# Altium schematic sheet COM.schdoc
size 297 x 210 mm; Symbol: Sheet-Symbol_A4; Company: 嘉立创EDA; Version: V1.0; Page Size: A4; @Project Name: 【全网首发】X86电脑主板_copy; @Page Count: 19; @Update Date: 2025-10-09; @Create Date: 2025-10-09; @Schematic Name: SCHEMATIC1_1; @Page No: 0; @Page Name: COM; Device: Sheet-Symbol_A4_1
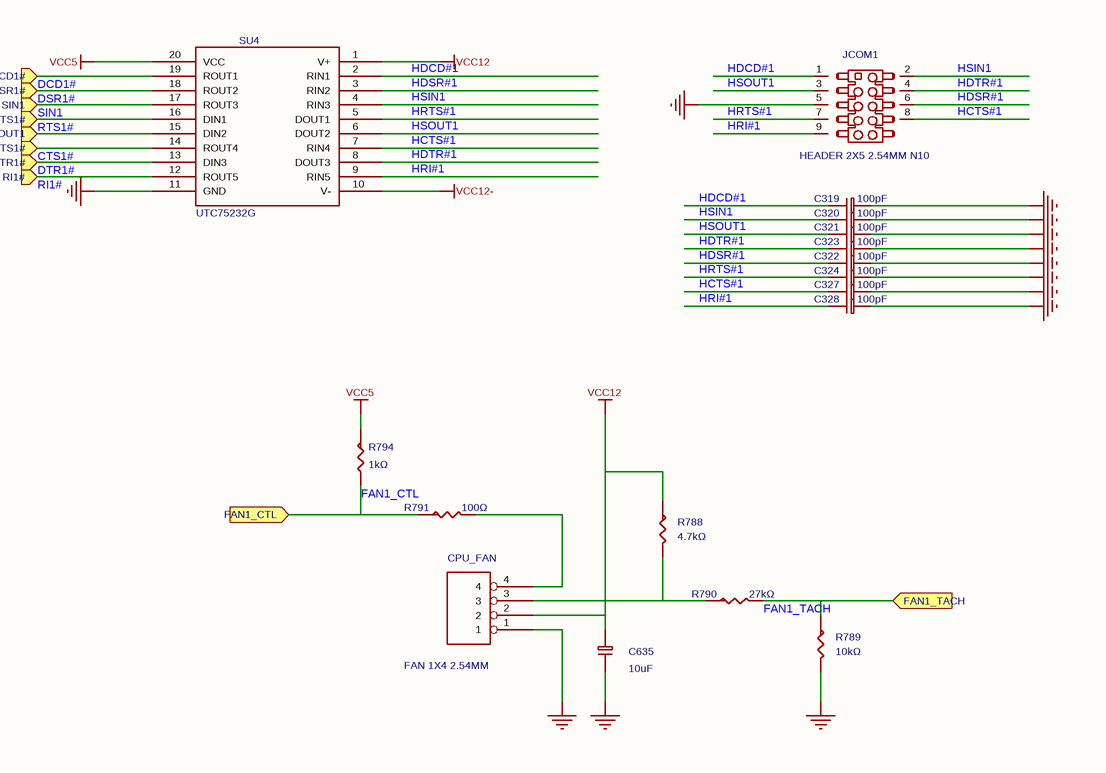
[diagram p0: COM.schdoc]

## Parts
C319  100pF  [C0402_2]
C320  100pF  [C0402]
C321  100pF  [C0402]
C322  100pF  [C0402_2]
C323  100pF  [C0402]
C324  100pF  [C0402]
C327  100pF  [C0402]
C328  100pF  [C0402]
C635  10uF  [C0805]
CPU_FAN  value FAN 1X4 2.54MM  [FAN4P]  (hidden comment: HF1004E)
JCOM1  value HEADER 2X5 2.54MM N10  [PIN2X5_2D54_NC10]  (hidden comment: 210-92-05GB02)
R788  4.7kΩ  [R0402_1]
R789  10kΩ  [R0402_3]
R790  27kΩ  [R0402_1]
R791  100Ω  [R0402_1]
R794  1kΩ  [R0402_3]
SU4  value UTC75232G  [TSSOP20]  (hidden comment: DS14185_0)

## Ports
CTS1# (in), DCD1# (in), DSR1# (in), DTR1# (in), FAN1_CTL (in), FAN1_TACH (in), RI1# (in), RTS1# (in), SIN1 (in), SOUT1 (in)

## Nets
GND: C319.2 C320.2 C321.2 C322.2 C323.2 C324.2 C327.2 C328.2 C635.1 CPU_FAN.1 JCOM1.5 R789.2 SU4.11(GND)
VCC5: R794.1 SU4.20(VCC)
VCC12: C635.2 CPU_FAN.2 R788.1 SU4.1(V+)
VCC12-: SU4.10(V-)
CTS1#: SU4.14(ROUT4) ; port CTS1#
DCD1#: SU4.19(ROUT1) ; port DCD1#
DSR1#: SU4.18(ROUT2) ; port DSR1#
DTR1#: SU4.13(DIN3) ; port DTR1#
FAN1_CTL: R791.1 R794.2 ; port FAN1_CTL
FAN1_TACH: R789.1 R790.2 ; port FAN1_TACH
HCTS#1: C327.1 JCOM1.8 SU4.7(RIN4)
HDCD#1: C319.1 JCOM1.1 SU4.2(RIN1)
HDSR#1: C322.1 JCOM1.6 SU4.3(RIN2)
HDTR#1: C323.1 JCOM1.4 SU4.8(DOUT3)
HRI#1: C328.1 JCOM1.9 SU4.9(RIN5)
HRTS#1: C324.1 JCOM1.7 SU4.5(DOUT1)
HSIN1: C320.1 JCOM1.2 SU4.4(RIN3)
HSOUT1: C321.1 JCOM1.3 SU4.6(DOUT2)
RI1#: SU4.12(ROUT5) ; port RI1#
RTS1#: SU4.16(DIN1) ; port RTS1#
SIN1: SU4.17(ROUT3) ; port SIN1
SOUT1: SU4.15(DIN2) ; port SOUT1
NetCPU_FAN_3: CPU_FAN.3 R788.2 R790.1
NetCPU_FAN_4: CPU_FAN.4 R791.2

## Notes on the sheet
- 更新日期
- 2025-10-09
- 原理图
- 图页
- SCHEMATIC1_1
- COM
- 创建日期
- 物料编码
- 审阅
- 绘制
- 【全网首发】X86电脑主板_copy
- 版本
- V1.0
- 尺寸
- A4
- 页
- 0
- 嘉立创EDA
- 共
- 19

## Library data of the parts
C319-C324 C327 C328 = 0402CG101J500NT: 容值:100pF;精度:±5%;额定电压:50V;材质(温度系数):C0G;; Manufacturer: FH(风华); Symbol: C-0603_4; ModelId: 36a51122f27c49738f86b3bfa98863e0; Tolerance: ±5%; AddInBom: yes; Voltage Rated: 50V; ModelName: C0402_L1.0-W0.5-H0.5; ModelTransform: 39.37,19.685,0,0,0,0,0,0,0; Temperature Coefficient: C0G; Device: 0402CG101J500NT; Value: 100pF; Supplier: LCSC; SupplierPart: C1546; ConvertToPcb: yes; LCSC Part Name: 100pF ±5% 50V; JLCPCB Part Class: Basic Part; ManufacturerPart: 0402CG101J500NT; Supplier Footprint: 0402
  C319 C322: FootprintName: C0402_2
  C320 C321 C323 C324 C327 C328: FootprintName: C0402
C635 = CL21A106KOQNNNE: 容值:10uF;精度:±10%;额定电压:16V;材质(温度系数):X5R;; Manufacturer: SAMSUNG(三星); Symbol: CAP NP_31; ModelId: 1ba041120af144c991958decab20d241; Tolerance: ±10%; AddInBom: yes; Voltage Rated: 16V; ModelName: C0805_L2.0-W1.3-H1.3; ModelTransform: 78.74,51.181,0,0,0,0,0,0.0005,0; Temperature Coefficient: X5R; Device: CL21A106KOQNNNE; Value: 10uF; Supplier: LCSC; Datasheet: https://atta.szlcsc.com/upload/public/pdf/source/20160103/1457707694240.pdf; FootprintName: C0805; SupplierPart: C1713; ConvertToPcb: yes; LCSC Part Name: 10uF ±10% 16V; JLCPCB Part Class: Extended Part; ManufacturerPart: CL21A106KOQNNNE; Supplier Footprint: 0805
CPU_FAN = HF1004E: 插针结构:1x4P;间距:2.54mm;安装方式:直插;参考系列:-;总PIN数:4P;排数:1;每排PIN数:4;行距:-;额定电流:-;工作温度范围:-;; Manufacturer: FOXCONN(富士康); Symbol: HEADER 4_0; AddInBom: yes; ModelId: ec34a5bd49134116a835459c2f382328; ModelName: CONN-TH_4P-P2.54_HF1004E; ModelTransform: 400.039,225.1964,0,0,0,0,0,12.008,-137.795; Pins Structure: 1x4P; Pitch: 2.54mm; Number of PINs Per Row: 4; Device: HF1004E; JLCPCB Part Class: Extended Part; LCSC Part Name: 1x4P 间距:2.54mm 直插; SupplierPart: C2761402; ManufacturerPart: HF1004E; Supplier Footprint: 插件,P=2.54mm; Datasheet: https://atta.szlcsc.com/upload/public/pdf/source/20210329/C2761402_8B7F6B32F26E3706188E3A95E69D0044.pdf; Supplier: LCSC; ConvertToPcb: yes; FootprintName: FAN4P; Mounting Style: 直插; Reference Series: -; Number of Pins: 4P; Number of Rows: 1; Row Spacing: -; Current Rating (Max): -; Operating Temperature Range: -
JCOM1 = 210-92-05GB02: 插针结构:2x5P;间距:2.54mm;行距:2.54mm;圆针/方针:方针;安装类型:直插;排数:双排;总PIN位数:10P;额定电流:3A;额定电压:-;配合针长度:6.1mm;塑高:2.5mm;端接针长度:3mm;触头材质:黄铜;触头镀层:-;工作温度范围:-40℃~+105℃;颜色:黑色;; Manufacturer: PINREX(频锐科技); Symbol: PIN HEADER 2X7 2_0.54; AddInBom: yes; ModelId: 4a96607ad93f48408c2a0a6543c48f7d; ModelName: HDR-TH_9P-P2.54-M-LI-2X5P; ModelTransform: 490.157,196.85,0,0,0,0,0,0,-118.11; Pin Structure: 2x5P; Pitch: 2.54mm; Circluar Pins/Square Pins: 方针; Current Rating (Max): 3A; Device: 210-92-05GB02; JLCPCB Part Class: Extended Part; LCSC Part Name: 间距:2.54mm 2x5P 直插 方针 黑金; SupplierPart: C390689; ManufacturerPart: 210-92-05GB02; Supplier Footprint: 插件,P=2.54mm; Datasheet: https://atta.szlcsc.com/upload/public/pdf/source/20190506/C390689_DC56D71BCD7C484749B58F96D2D2D6C5.pdf; Supplier: LCSC; ConvertToPcb: yes; FootprintName: PIN2X5_2D54_NC10; Row Spacing: 2.54mm; Mounting Type: 直插; Number of Rows: 双排; Number of Pins: 10P; Voltage Rating (Max): -; Length of Mating Pin: 6.1mm; Insulation Height: 2.5mm; Length of End Connection Pin: 3mm; Contact Material: 黄铜; Contact Plating: -; Operating Temperature Range: -40℃~+105℃; Color: 黑色
R788 = 0402WGF4701TCE: 电阻类型:厚膜电阻;阻值:4.7kΩ;精度:±1%;功率:62.5mW;; Manufacturer: UNI-ROYAL(厚声); Symbol: RESISTOR; ModelId: 671aefced39d4c318694bba8bd8efd39; Tolerance: ±1%; AddInBom: yes; Power(Watts): 62.5mW; ModelName: R0402_L1.0-W0.5-H0.5; ModelTransform: 39.37,19.685,0,0,0,0,0,0.0005,0; Overload Voltage (Max): 50V; Temperature Coefficient: ±100ppm/℃; Device: 0402WGF4701TCE; Value: 4.7kΩ; Type: 厚膜电阻; Supplier: LCSC; Datasheet: https://atta.szlcsc.com/upload/public/pdf/source/20200306/C422600_1E6D84923E4A46A82E41ADD87F860B5C.pdf; FootprintName: R0402_1; SupplierPart: C25900; ConvertToPcb: yes; LCSC Part Name: 4.7kΩ ±1% 62.5mW; JLCPCB Part Class: Basic Part; ManufacturerPart: 0402WGF4701TCE; Supplier Footprint: 0402; Operating Temperature Range: -55℃~+155℃
R789 = 0402WGF1002TCE: 电阻类型:厚膜电阻;阻值:10kΩ;精度:±1%;功率:62.5mW;; Manufacturer: UNI-ROYAL(厚声); Symbol: RESISTOR; ModelId: 671aefced39d4c318694bba8bd8efd39; Tolerance: ±1%; AddInBom: yes; Power(Watts): 62.5mW; ModelName: R0402_L1.0-W0.5-H0.5; ModelTransform: 39.37,19.685,0,0,0,0,0,0.0005,0; Overload Voltage (Max): 50V; Temperature Coefficient: ±100ppm/℃; Device: 0402WGF1002TCE; Value: 10kΩ; Type: 厚膜电阻; Supplier: LCSC; Datasheet: https://atta.szlcsc.com/upload/public/pdf/source/20200306/C422600_1E6D84923E4A46A82E41ADD87F860B5C.pdf; FootprintName: R0402_3; SupplierPart: C25744; ConvertToPcb: yes; LCSC Part Name: 10kΩ ±1% 62.5mW; JLCPCB Part Class: Basic Part; ManufacturerPart: 0402WGF1002TCE; Supplier Footprint: 0402; Operating Temperature Range: -55℃~+155℃
R790 = 0402WGF2702TCE: 电阻类型:厚膜电阻;阻值:27kΩ;精度:±1%;功率:62.5mW;; Manufacturer: UNI-ROYAL(厚声); Symbol: RESISTOR; ModelId: 671aefced39d4c318694bba8bd8efd39; Tolerance: ±1%; AddInBom: yes; Power(Watts): 62.5mW; ModelName: R0402_L1.0-W0.5-H0.5; ModelTransform: 39.37,19.685,0,0,0,0,0,0.0005,0; Overload Voltage (Max): 50V; Temperature Coefficient: ±100ppm/℃; Device: 0402WGF2702TCE; Value: 27kΩ; Type: 厚膜电阻; Supplier: LCSC; Datasheet: https://atta.szlcsc.com/upload/public/pdf/source/20200306/C422600_1E6D84923E4A46A82E41ADD87F860B5C.pdf; FootprintName: R0402_1; SupplierPart: C25771; ConvertToPcb: yes; LCSC Part Name: 27kΩ ±1% 62.5mW; JLCPCB Part Class: Basic Part; ManufacturerPart: 0402WGF2702TCE; Supplier Footprint: 0402; Operating Temperature Range: -55℃~+155℃
R791 = 0402WGF1000TCE: 电阻类型:厚膜电阻;阻值:100Ω;精度:±1%;功率:62.5mW;; Manufacturer: UNI-ROYAL(厚声); Symbol: RESISTOR; ModelId: 671aefced39d4c318694bba8bd8efd39; Tolerance: ±1%; AddInBom: yes; Power(Watts): 62.5mW; ModelName: R0402_L1.0-W0.5-H0.5; ModelTransform: 39.37,19.685,0,0,0,0,0,0.0005,0; Overload Voltage (Max): 50V; Temperature Coefficient: ±200ppm/℃; Device: 0402WGF1000TCE; Value: 100Ω; Type: 厚膜电阻; Supplier: LCSC; Datasheet: https://atta.szlcsc.com/upload/public/pdf/source/20200306/C422600_1E6D84923E4A46A82E41ADD87F860B5C.pdf; FootprintName: R0402_1; SupplierPart: C25076; ConvertToPcb: yes; LCSC Part Name: 100Ω ±1% 62.5mW; JLCPCB Part Class: Basic Part; ManufacturerPart: 0402WGF1000TCE; Supplier Footprint: 0402; Operating Temperature Range: -55℃~+155℃
R794 = 0402WGF1001TCE: 电阻类型:厚膜电阻;阻值:1kΩ;精度:±1%;功率:62.5mW;; Manufacturer: UNI-ROYAL(厚声); Symbol: RESISTOR; ModelId: 671aefced39d4c318694bba8bd8efd39; Tolerance: ±1%; AddInBom: yes; Power(Watts): 62.5mW; ModelName: R0402_L1.0-W0.5-H0.5; ModelTransform: 39.37,19.685,0,0,0,0,0,0.0005,0; Overload Voltage (Max): 50V; Temperature Coefficient: ±100ppm/℃; Device: 0402WGF1001TCE; Value: 1kΩ; Type: 厚膜电阻; Supplier: LCSC; Datasheet: https://atta.szlcsc.com/upload/public/pdf/source/20200306/C422600_1E6D84923E4A46A82E41ADD87F860B5C.pdf; FootprintName: R0402_3; SupplierPart: C11702; ConvertToPcb: yes; LCSC Part Name: 1kΩ ±1% 62.5mW; JLCPCB Part Class: Basic Part; ManufacturerPart: 0402WGF1001TCE; Supplier Footprint: 0402; Operating Temperature Range: -55℃~+155℃
SU4 = DS14185_0: Check: false; AddInBom: yes; Device: DS14185_0; Symbol: DS14185_0; FootprintName: TSSOP20; ConvertToPcb: yes